# Altium schematic sheet ETC.SchDoc: Controle eletrônico da borboleta
size 420 x 297 mm; Author: Matheus Markies; DrawnBy: Matheus Markies; Engineer: Matheus Markies; DocumentNumber: ECTU-SCH-10; Revision: A definir; SheetNumber: 10; SheetTotal: 12; ProjectTitle: ROUTE ECU / ECTU; DocumentStatus: Em desenvolvimento; DocumentDate: 14/10/2026
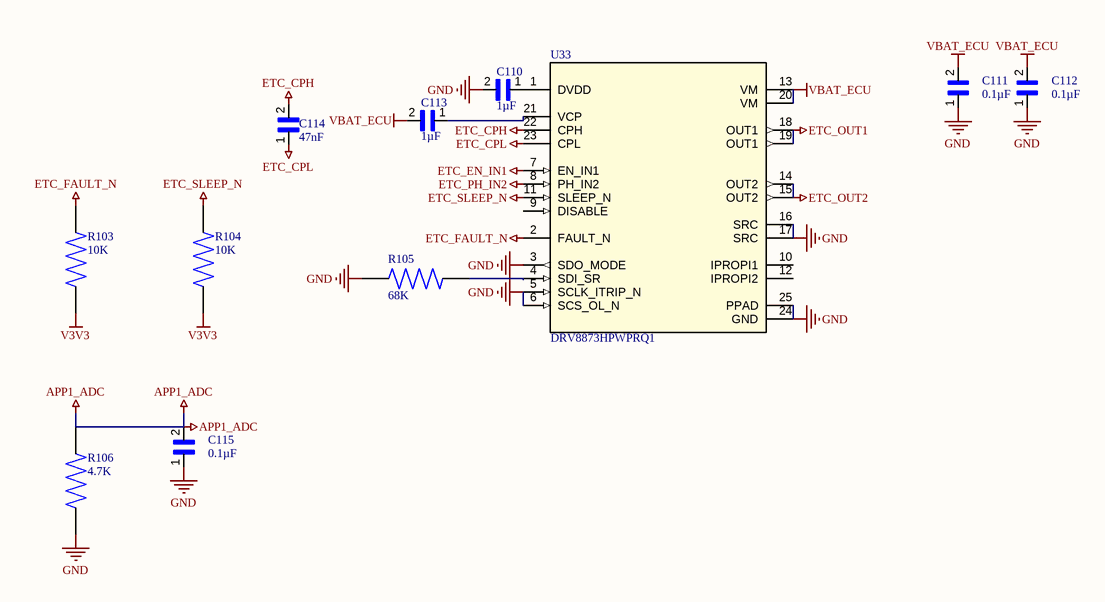
[diagram p0: ETC.SchDoc]

## Parts
C110  1µF  [CAPC1608X90N]
C111  0.1µF  [CAPC1608X90N]
C112  0.1µF  [CAPC1608X90N]
C113  1µF  [CAPC1608X90N]
C114  47nF  [CAPC1608X90N]
C115  0.1µF  [CAPC1608X90N]
R103  10K  [RESC3116X65N]
R104  10K  [RESC3116X65N]
R105  68K  [RESC3116X65N]
R106  4.7K  [RESC3116X65N]
U33  DRV8873HPWPRQ1  [PWP0024J_N]

## Nets
APP1_ADC: C115.2 R106.2
ETC_CPH: C114.2 U33.22(CPH)
ETC_CPL: C114.1 U33.23(CPL)
ETC_EN_IN1: U33.7(EN_IN1)
ETC_FAULT_N: R103.1 U33.2(FAULT_N)
ETC_OUT1: U33.18(OUT1) U33.19(OUT1)
ETC_OUT2: U33.14(OUT2) U33.15(OUT2)
ETC_PH_IN2: U33.8(PH_IN2)
ETC_SLEEP_N: R104.1 U33.11(SLEEP_N)
GND: C110.2 C111.1 C112.1 C115.1 R105.2 R106.1 U33.3(SDO_MODE) U33.5(SCLK_ITRIP_N) U33.6(SCS_OL_N) U33.16(SRC) U33.17(SRC) U33.24(GND) U33.25(PPAD)
V3V3: R103.2 R104.2
VBAT_ECU: C111.2 C112.2 C113.2 U33.13(VM) U33.20(VM)
NetC110_1: C110.1 U33.1(DVDD)
NetC113_1: C113.1 U33.21(VCP)
NetR105_1: R105.1 U33.4(SDI_SR)

Not connected (* = marked no-connect by the designer): U33 9(DISABLE) 10(IPROPI1) 12(IPROPI2)

## Notes on the sheet
- PROJETO
- STATUS
- FOLHA / SUBSISTEMA
- AUTOR
- CÓDIGO DO DESENHO
- ARQUIVO
- ATUALIZAÇÃO
- REVISÃO
- FOLHA
- FORMATO
- A3
- /

## Library data of the parts
C110-C115 = 06035C104MAZ2A: Multilayer Ceramic Capacitors MLCC - SMD/SMT; Package: None; Price: None; Value: *; MP: 06035C104MAZ2A; Availability: Unavailable
R103-R106 = RC1206FR-074K7L: 4.7 kOhms Â±1% 0.25W, 1/4W Chip Resistor 1206 (3216 Metric) Moisture Resistant Thick Film; MF: Yageo; SnapEDA_Link: https://www.snapeda.com/parts/RC1206FR-074K7L/Yageo/view-part/?ref=snap; Package: 3116 Yageo; Value: *; MP: RC1206FR-074K7L; Check_prices: https://www.snapeda.com/parts/RC1206FR-074K7L/Yageo/view-part/?ref=eda
U33 = DRV8873HPWPRQ1: Automotive, current sensing 40V, 10A H-bridge motor driver with integrated current feedback 24-HTSSOP -40 to 125; Manufacturer_Name: Texas Instruments; TYPE: TYPE; RefDes: RefDes; Copyright: Copyright (C) 2026 Ultra Librarian. All rights reserved.; Manufacturer_Part_Number: DRV8873HPWPRQ1